# Altium schematic sheet 08_Ethernet.SchDoc
size 812 x 508 mm; SheetNumber: 8; SheetTotal: 16
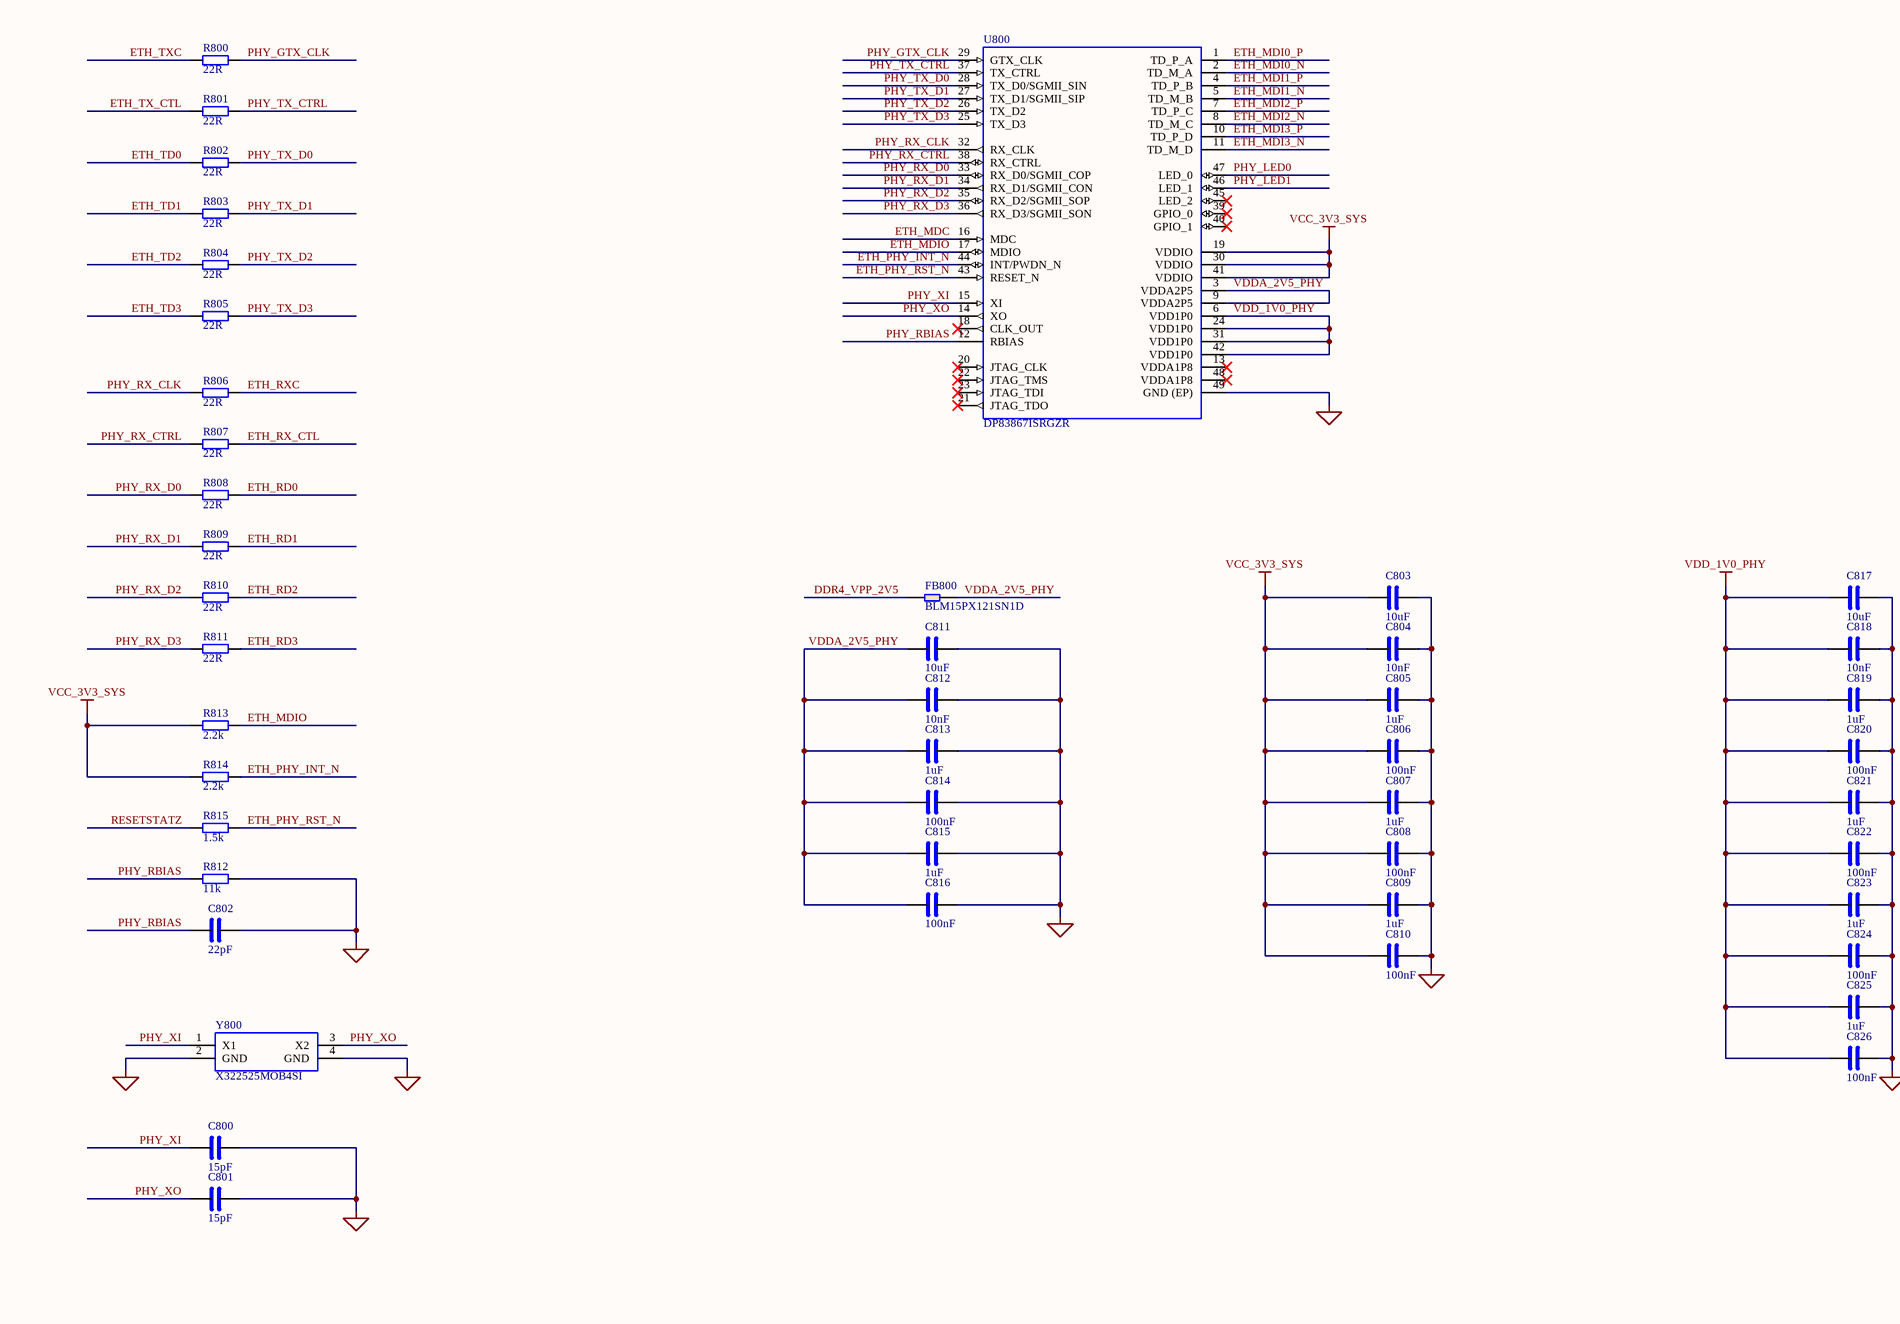
[diagram p0: 08_Ethernet.SchDoc, left]
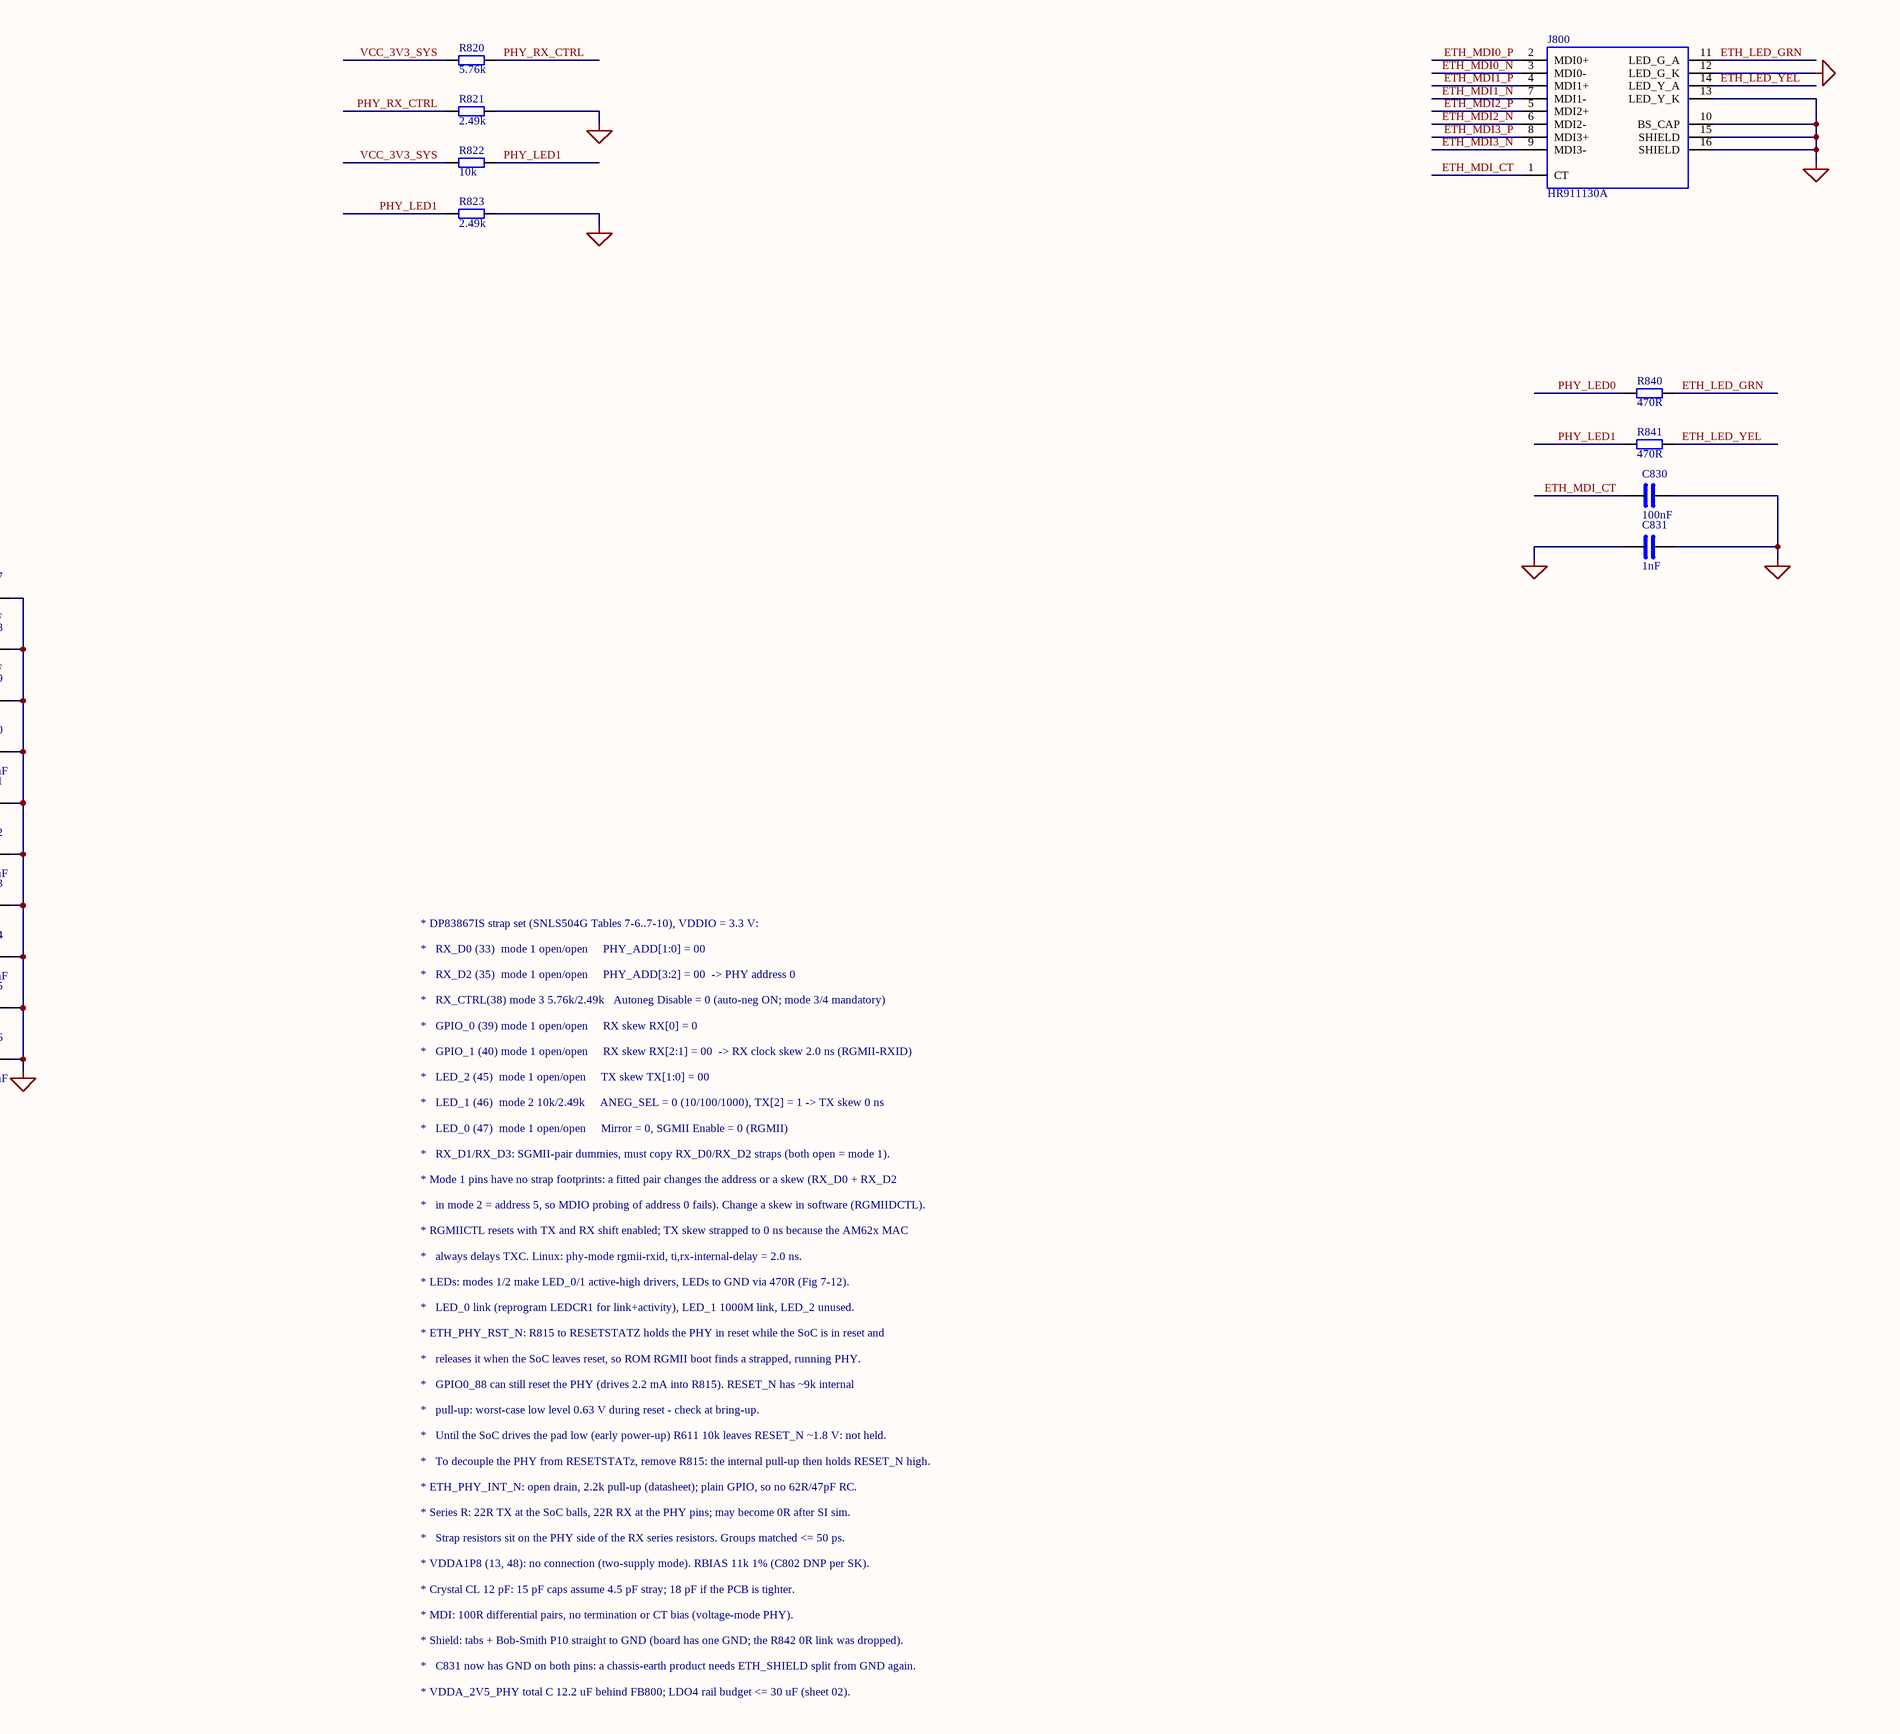
[diagram p1: 08_Ethernet.SchDoc, right]

## Parts
C800  15pF  [C0402]
C801  15pF  [C0402]
C802  22pF  [C0402]
C803  10uF  [C0603]
C804  10nF  [C0402]
C805  1uF  [C0402]
C806  100nF  [C0402]
C807  1uF  [C0402]
C808  100nF  [C0402]
C809  1uF  [C0402]
C810  100nF  [C0402]
C811  10uF  [C0603]
C812  10nF  [C0402]
C813  1uF  [C0402]
C814  100nF  [C0402]
C815  1uF  [C0402]
C816  100nF  [C0402]
C817  10uF  [C0603]
C818  10nF  [C0402]
C819  1uF  [C0402]
C820  100nF  [C0402]
C821  1uF  [C0402]
C822  100nF  [C0402]
C823  1uF  [C0402]
C824  100nF  [C0402]
C825  1uF  [C0402]
C826  100nF  [C0402]
C830  100nF  [C0402]
C831  1nF  [C1206]
FB800  BLM15PX121SN1D  [FB0402]
J800  HR911130A  [RJ45_HANRUN_HR911130A]
R800  22R  [R0402]
R801  22R  [R0402]
R802  22R  [R0402]
R803  22R  [R0402]
R804  22R  [R0402]
R805  22R  [R0402]
R806  22R  [R0402]
R807  22R  [R0402]
R808  22R  [R0402]
R809  22R  [R0402]
R810  22R  [R0402]
R811  22R  [R0402]
R812  11k  [R0402]
R813  2.2k  [R0402]
R814  2.2k  [R0402]
R815  1.5k  [R0402]
R820  5.76k  [R0402]
R821  2.49k  [R0402]
R822  10k  [R0402]
R823  2.49k  [R0402]
R840  470R  [R0402]
R841  470R  [R0402]
U800  DP83867ISRGZR  [VQFN48_RGZ_7X7]
Y800  X322525MOB4SI  [XTAL_3225_4P]

## Nets
GND: C800.2 C801.2 C802.2 C803.2 C804.2 C805.2 C806.2 C807.2 C808.2 C809.2 C810.2 C811.2 C812.2 C813.2 C814.2 C815.2 C816.2 C817.2 C818.2 C819.2 C820.2 C821.2 C822.2 C823.2 C824.2 C825.2 C826.2 C830.2 C831.1 C831.2 J800.10(BS_CAP) J800.12(LED_G_K) J800.13(LED_Y_K) J800.15(SHIELD) J800.16(SHIELD) R812.2 R821.2 R823.2 U800.49(GND_(EP)) Y800.2(GND) Y800.4(GND)
VCC_3V3_SYS: C803.1 C804.1 C805.1 C806.1 C807.1 C808.1 C809.1 C810.1 R813.1 R814.1 R820.1 R822.1 U800.19(VDDIO) U800.30(VDDIO) U800.41(VDDIO)
VDD_1V0_PHY: C817.1 C818.1 C819.1 C820.1 C821.1 C822.1 C823.1 C824.1 C825.1 C826.1 U800.6(VDD1P0) U800.24(VDD1P0) U800.31(VDD1P0) U800.42(VDD1P0)
DDR4_VPP_2V5: FB800.1
ETH_LED_GRN: J800.11(LED_G_A) R840.2
ETH_LED_YEL: J800.14(LED_Y_A) R841.2
ETH_MDC: U800.16(MDC)
ETH_MDI0_N: J800.3(MDI0-) U800.2(TD_M_A)
ETH_MDI0_P: J800.2(MDI0+) U800.1(TD_P_A)
ETH_MDI1_N: J800.7(MDI1-) U800.5(TD_M_B)
ETH_MDI1_P: J800.4(MDI1+) U800.4(TD_P_B)
ETH_MDI2_N: J800.6(MDI2-) U800.8(TD_M_C)
ETH_MDI2_P: J800.5(MDI2+) U800.7(TD_P_C)
ETH_MDI3_N: J800.9(MDI3-) U800.11(TD_M_D)
ETH_MDI3_P: J800.8(MDI3+) U800.10(TD_P_D)
ETH_MDI_CT: C830.1 J800.1(CT)
ETH_MDIO: R813.2 U800.17(MDIO)
ETH_PHY_INT_N: R814.2 U800.44(INT/PWDN_N)
ETH_PHY_RST_N: R815.2 U800.43(RESET_N)
ETH_RD0: R808.2
ETH_RD1: R809.2
ETH_RD2: R810.2
ETH_RD3: R811.2
ETH_RX_CTL: R807.2
ETH_RXC: R806.2
ETH_TD0: R802.1
ETH_TD1: R803.1
ETH_TD2: R804.1
ETH_TD3: R805.1
ETH_TX_CTL: R801.1
ETH_TXC: R800.1
PHY_GTX_CLK: R800.2 U800.29(GTX_CLK)
PHY_LED0: R840.1 U800.47(LED_0)
PHY_LED1: R822.2 R823.1 R841.1 U800.46(LED_1)
PHY_RBIAS: C802.1 R812.1 U800.12(RBIAS)
PHY_RX_CLK: R806.1 U800.32(RX_CLK)
PHY_RX_CTRL: R807.1 R820.2 R821.1 U800.38(RX_CTRL)
PHY_RX_D0: R808.1 U800.33(RX_D0/SGMII_COP)
PHY_RX_D1: R809.1 U800.34(RX_D1/SGMII_CON)
PHY_RX_D2: R810.1 U800.35(RX_D2/SGMII_SOP)
PHY_RX_D3: R811.1 U800.36(RX_D3/SGMII_SON)
PHY_TX_CTRL: R801.2 U800.37(TX_CTRL)
PHY_TX_D0: R802.2 U800.28(TX_D0/SGMII_SIN)
PHY_TX_D1: R803.2 U800.27(TX_D1/SGMII_SIP)
PHY_TX_D2: R804.2 U800.26(TX_D2)
PHY_TX_D3: R805.2 U800.25(TX_D3)
PHY_XI: C800.1 U800.15(XI) Y800.1(X1)
PHY_XO: C801.1 U800.14(XO) Y800.3(X2)
RESETSTATZ: R815.1
VDDA_2V5_PHY: C811.1 C812.1 C813.1 C814.1 C815.1 C816.1 FB800.2 U800.3(VDDA2P5) U800.9(VDDA2P5)

Not connected (* = marked no-connect by the designer): U800 13(VDDA1P8)* 18(CLK_OUT)* 20(JTAG_CLK)* 21(JTAG_TDO)* 22(JTAG_TMS)* 23(JTAG_TDI)* 39(GPIO_0)* 40(GPIO_1)* 45(LED_2)* 48(VDDA1P8)*

## Notes on the sheet
- * DP83867IS strap set (SNLS504G Tables 7-6..7-10), VDDIO = 3.3 V:
- *   RX_D0 (33)  mode 1 open/open     PHY_ADD[1:0] = 00
- *   RX_D2 (35)  mode 1 open/open     PHY_ADD[3:2] = 00  -> PHY address 0
- *   RX_CTRL(38) mode 3 5.76k/2.49k   Autoneg Disable = 0 (auto-neg ON; mode 3/4 mandatory)
- *   GPIO_0 (39) mode 1 open/open     RX skew RX[0] = 0
- *   GPIO_1 (40) mode 1 open/open     RX skew RX[2:1] = 00  -> RX clock skew 2.0 ns (RGMII-RXID)
- *   LED_2 (45)  mode 1 open/open     TX skew TX[1:0] = 00
- *   LED_1 (46)  mode 2 10k/2.49k     ANEG_SEL = 0 (10/100/1000), TX[2] = 1 -> TX skew 0 ns
- *   LED_0 (47)  mode 1 open/open     Mirror = 0, SGMII Enable = 0 (RGMII)
- *   RX_D1/RX_D3: SGMII-pair dummies, must copy RX_D0/RX_D2 straps (both open = mode 1).
- * Mode 1 pins have no strap footprints: a fitted pair changes the address or a skew (RX_D0 + RX_D2
- *   in mode 2 = address 5, so MDIO probing of address 0 fails). Change a skew in software (RGMIIDCTL).
- * RGMIICTL resets with TX and RX shift enabled; TX skew strapped to 0 ns because the AM62x MAC
- *   always delays TXC. Linux: phy-mode rgmii-rxid, ti,rx-internal-delay = 2.0 ns.
- * LEDs: modes 1/2 make LED_0/1 active-high drivers, LEDs to GND via 470R (Fig 7-12).
- *   LED_0 link (reprogram LEDCR1 for link+activity), LED_1 1000M link, LED_2 unused.
- * ETH_PHY_RST_N: R815 to RESETSTATZ holds the PHY in reset while the SoC is in reset and
- *   releases it when the SoC leaves reset, so ROM RGMII boot finds a strapped, running PHY.
- *   GPIO0_88 can still reset the PHY (drives 2.2 mA into R815). RESET_N has ~9k internal
- *   pull-up: worst-case low level 0.63 V during reset - check at bring-up.
- *   Until the SoC drives the pad low (early power-up) R611 10k leaves RESET_N ~1.8 V: not held.
- *   To decouple the PHY from RESETSTATz, remove R815: the internal pull-up then holds RESET_N high.
- * ETH_PHY_INT_N: open drain, 2.2k pull-up (datasheet); plain GPIO, so no 62R/47pF RC.
- * Series R: 22R TX at the SoC balls, 22R RX at the PHY pins; may become 0R after SI sim.
- *   Strap resistors sit on the PHY side of the RX series resistors. Groups matched <= 50 ps.
- * VDDA1P8 (13, 48): no connection (two-supply mode). RBIAS 11k 1% (C802 DNP per SK).
- * Crystal CL 12 pF: 15 pF caps assume 4.5 pF stray; 18 pF if the PCB is tighter.
- * MDI: 100R differential pairs, no termination or CT bias (voltage-mode PHY).
- * Shield: tabs + Bob-Smith P10 straight to GND (board has one GND; the R842 0R link was dropped).
- *   C831 now has GND on both pins: a chassis-earth product needs ETH_SHIELD split from GND again.
- * VDDA_2V5_PHY total C 12.2 uF behind FB800; LDO4 rail budget <= 30 uF (sheet 02).

## Library data of the parts
C800 C801 = CAP: Capacitor, non-polarized; Spec: 15pF 50V C0G 0402
C802 = CAP: Capacitor, non-polarized; DNP: 1; Spec: 22pF 50V C0G 0402 (DNP, SK compliance option)
C803 = CAP: Capacitor, non-polarized; Spec: 10uF 10V X5R 0603 (VDDIO bulk)
C804 = CAP: Capacitor, non-polarized; Spec: 10nF 25V X7R 0402 (VDDIO bulk)
C805 = CAP: Capacitor, non-polarized; Spec: 1uF 25V X5R 0402 (pin 19)
C806 = CAP: Capacitor, non-polarized; Spec: 100nF 16V X7R 0402 (pin 19)
C807 = CAP: Capacitor, non-polarized; Spec: 1uF 25V X5R 0402 (pin 30)
C808 = CAP: Capacitor, non-polarized; Spec: 100nF 16V X7R 0402 (pin 30)
C809 = CAP: Capacitor, non-polarized; Spec: 1uF 25V X5R 0402 (pin 41)
C810 = CAP: Capacitor, non-polarized; Spec: 100nF 16V X7R 0402 (pin 41)
C811 = CAP: Capacitor, non-polarized; Spec: 10uF 10V X5R 0603 (VDDA2P5 bulk)
C812 = CAP: Capacitor, non-polarized; Spec: 10nF 25V X7R 0402 (VDDA2P5 bulk)
C813 = CAP: Capacitor, non-polarized; Spec: 1uF 25V X5R 0402 (pin 3)
C814 = CAP: Capacitor, non-polarized; Spec: 100nF 16V X7R 0402 (pin 3)
C815 = CAP: Capacitor, non-polarized; Spec: 1uF 25V X5R 0402 (pin 9)
C816 = CAP: Capacitor, non-polarized; Spec: 100nF 16V X7R 0402 (pin 9)
C817 = CAP: Capacitor, non-polarized; Spec: 10uF 10V X5R 0603 (VDD1P0 bulk)
C818 = CAP: Capacitor, non-polarized; Spec: 10nF 25V X7R 0402 (VDD1P0 bulk)
C819 = CAP: Capacitor, non-polarized; Spec: 1uF 25V X5R 0402 (pin 6)
C820 = CAP: Capacitor, non-polarized; Spec: 100nF 16V X7R 0402 (pin 6)
C821 = CAP: Capacitor, non-polarized; Spec: 1uF 25V X5R 0402 (pin 24)
C822 = CAP: Capacitor, non-polarized; Spec: 100nF 16V X7R 0402 (pin 24)
C823 = CAP: Capacitor, non-polarized; Spec: 1uF 25V X5R 0402 (pin 31)
C824 = CAP: Capacitor, non-polarized; Spec: 100nF 16V X7R 0402 (pin 31)
C825 = CAP: Capacitor, non-polarized; Spec: 1uF 25V X5R 0402 (pin 42)
C826 = CAP: Capacitor, non-polarized; Spec: 100nF 16V X7R 0402 (pin 42)
C830 = CAP: Capacitor, non-polarized; Spec: 100nF 16V X7R 0402 (centre tap)
C831 = CAP: Capacitor, non-polarized; DNP: 1; Spec: 1nF 2kV X7R 1206 (DNP, AC-coupled shield option)
FB800 = FERRITE: Ferrite bead; Manufacturer: Murata; Spec: BLM15PX121SN1D 120R@100MHz 2A; MPN: BLM15PX121SN1D
J800 = HR911130A: RJ45 MagJack, 1000BASE-T 1CT:1CT magnetics, green/yellow LEDs, shielded (HanRun HR911130A); MPN: HR911130A; Manufacturer: HanRun; LCSC: C54408
R800-R805 = RES: Resistor; Spec: 22R 0402 (at SoC)
R806-R811 = RES: Resistor; Spec: 22R 0402 (at PHY)
R812 = RES: Resistor; Spec: 11k 1% 0402 (RBIAS)
R813 = RES: Resistor; Spec: 2.2k 0402 (MDIO pull-up)
R814 = RES: Resistor; Spec: 2.2k 0402 (INT open drain)
R815 = RES: Resistor; Spec: 1.5k 0402 (reset follows RESETSTATz)
R820 = RES: Resistor; Spec: 5.76k 1% 0402 (Rhi RX_CTRL mode 3)
R821 = RES: Resistor; Spec: 2.49k 1% 0402 (Rlo RX_CTRL mode 3)
R822 = RES: Resistor; Spec: 10k 1% 0402 (Rhi LED_1 mode 2)
R823 = RES: Resistor; Spec: 2.49k 1% 0402 (Rlo LED_1 mode 2)
R840 = RES: Resistor; Spec: 470R 0402 (green = LED_0 link)
R841 = RES: Resistor; Spec: 470R 0402 (yellow = LED_1 1000M)
U800 = DP83867_RGZ: DP83867IS/E/CS 10/100/1000 Ethernet PHY, RGMII/SGMII, VQFN-48 RGZ; Manufacturer: Texas Instruments; MPN: DP83867ISRGZR; LCSC: C543036
Y800 = XTAL4_3225: Crystal, 3.2x2.5 mm, 4 pads (1/3 crystal, 2/4 case GND); Manufacturer: YXC; Spec: X322525MOB4SI 25MHz 12pF 10ppm; MPN: X322525MOB4SI; LCSC: C9006